# EasyEDA Pro project six-port-baseboard-v01.epro, board PCB1
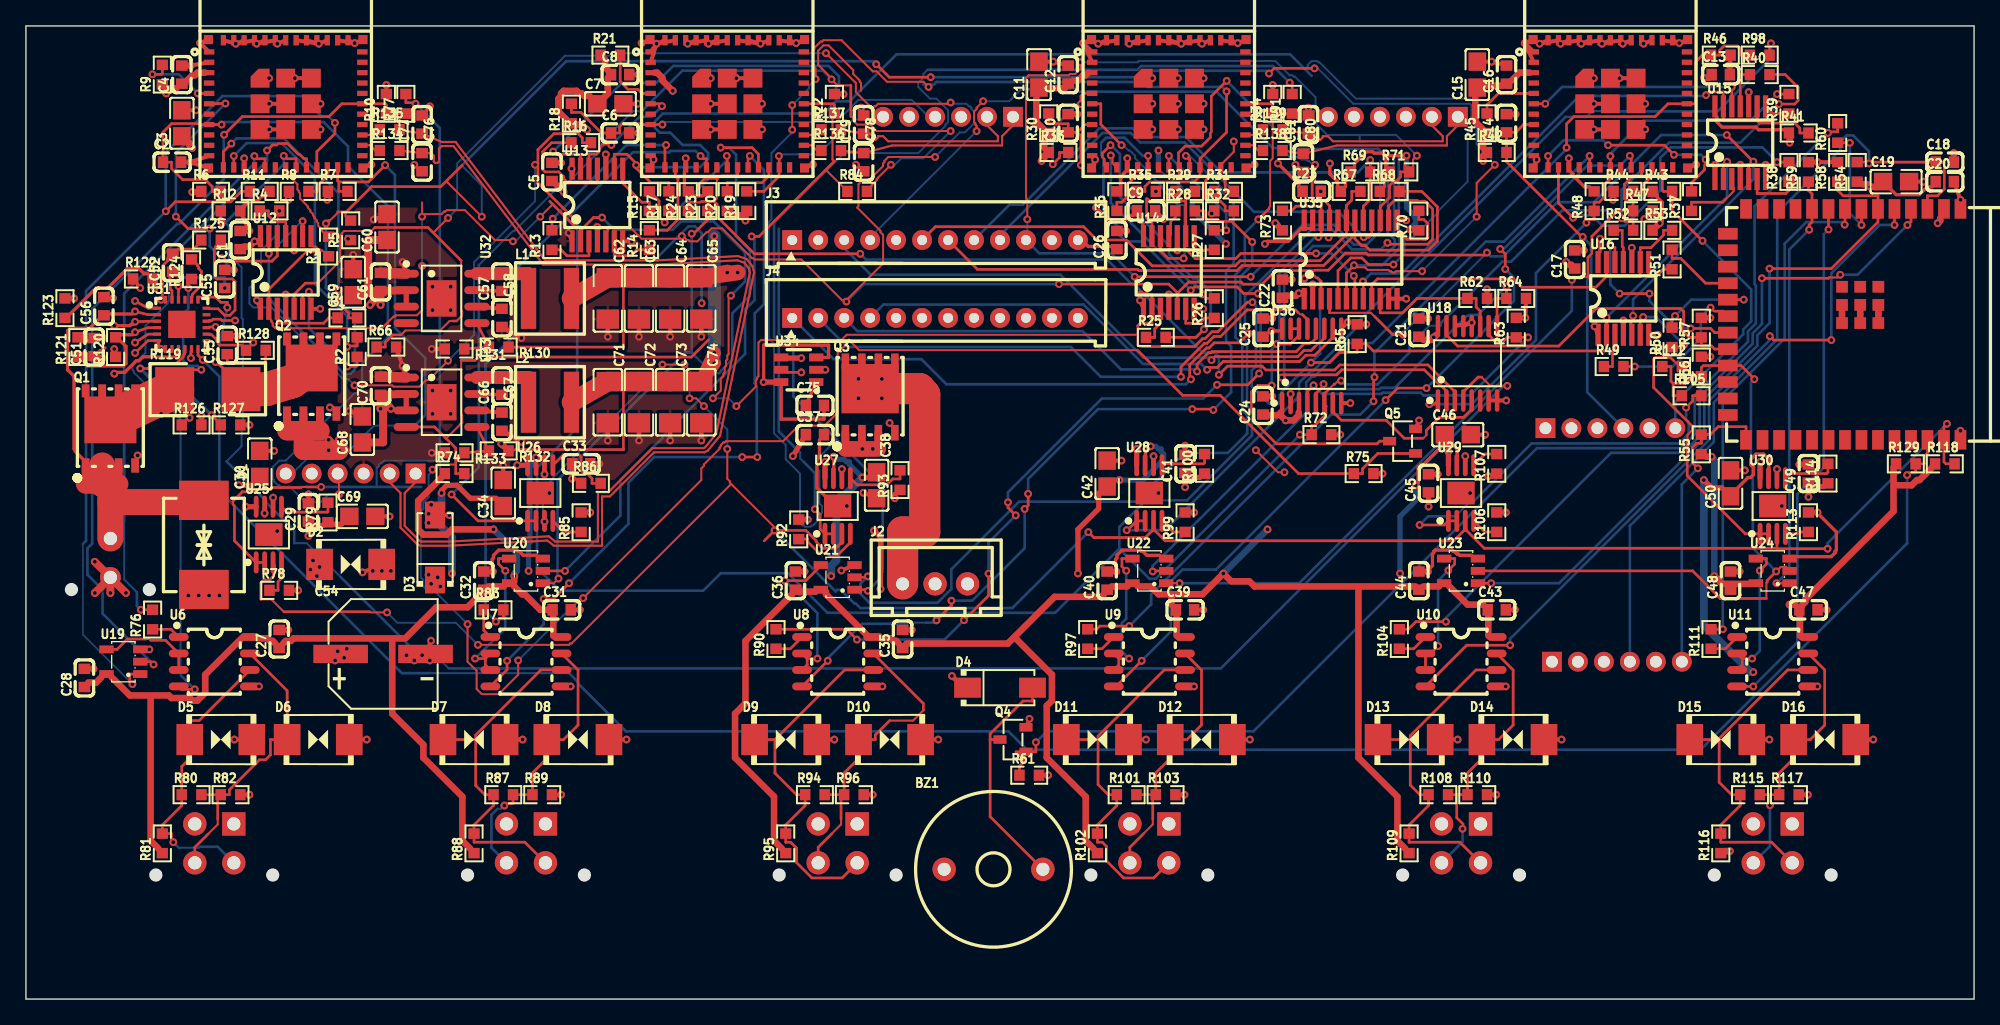
[diagram p12: board, top side]
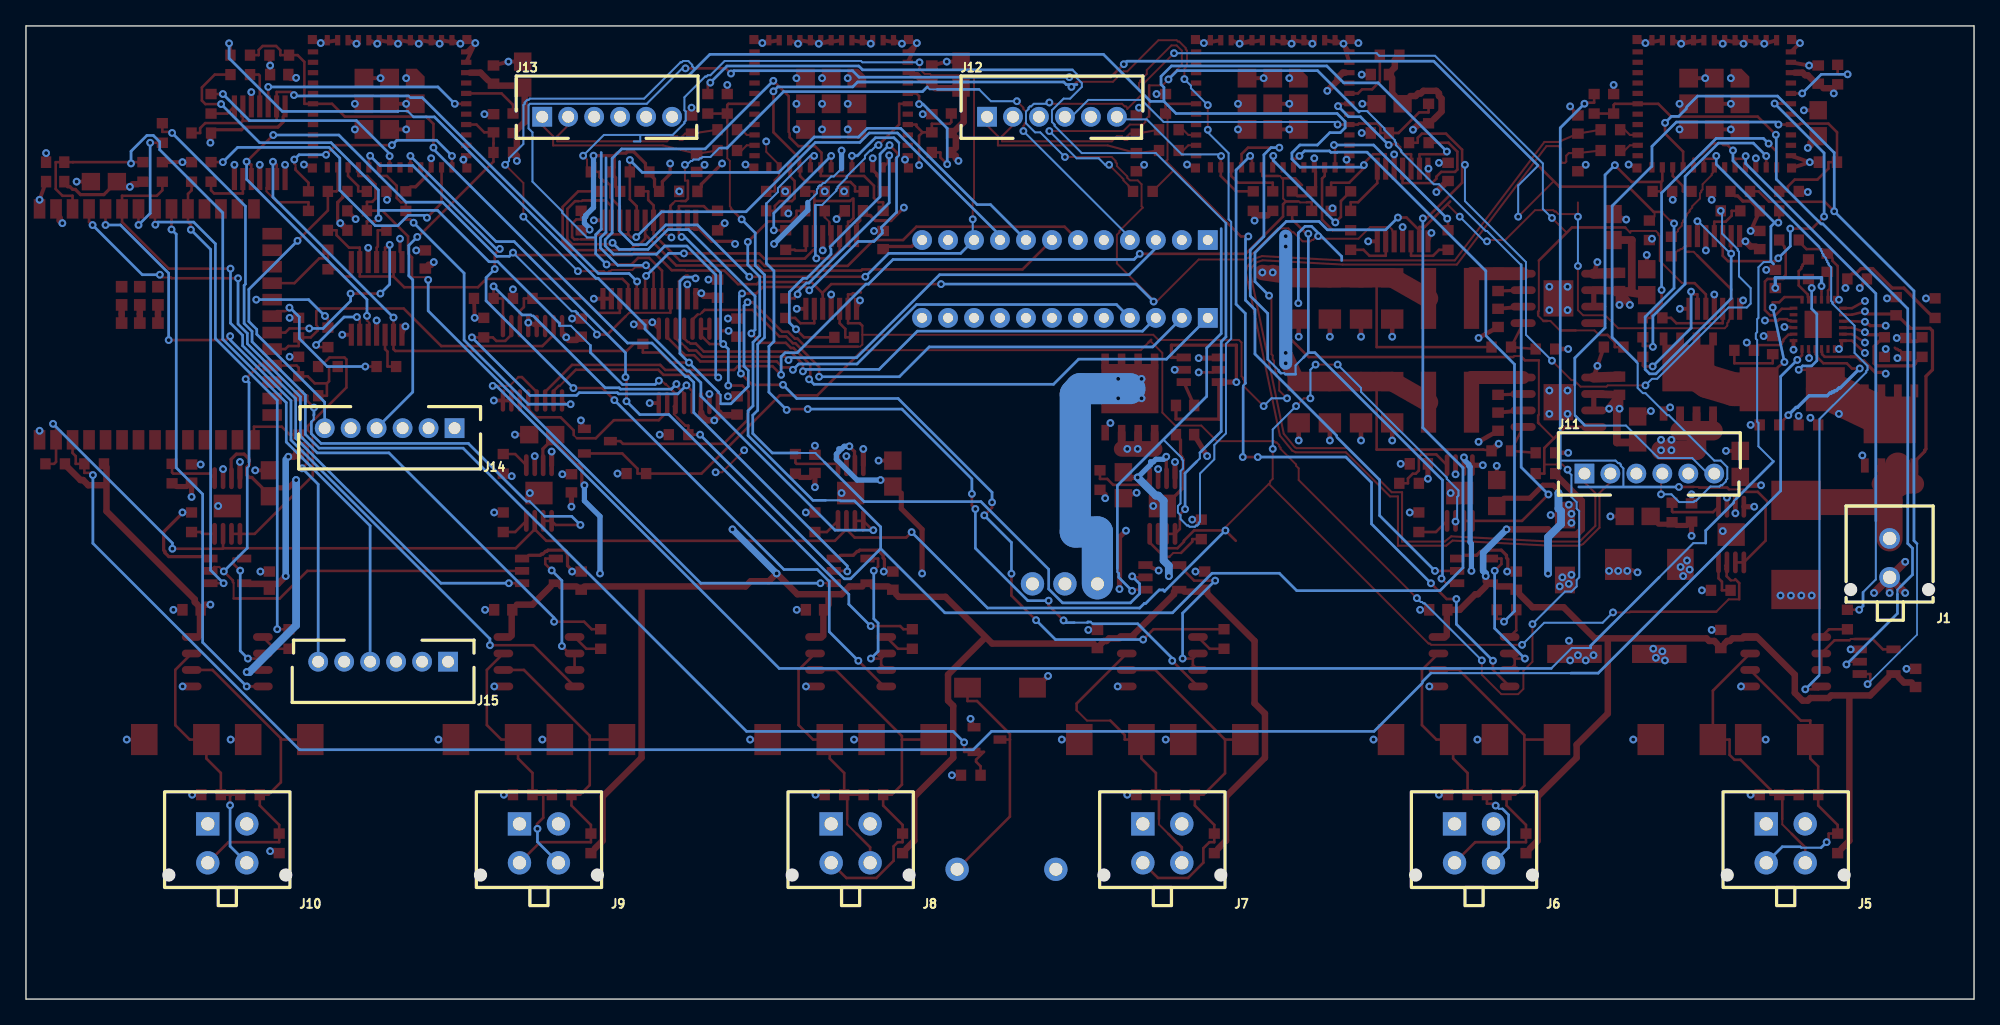
[diagram p13: board, bottom side, seen from below]

Outline 150 x 75 mm; copper layers: Top Layer, Inner1, Inner2, Bottom Layer. Coordinates in mm from the lower left corner of the outline.
Outline path: 0,75 150,75 150,0 0,0 0,75
Stack: Top Layer 0.035mm / Dielectric1 1.51mm FR4 er 4.5 / Bottom Layer 0.035mm

## Design rules (mm)
spacing copperThickness1oz (default): track to track 0.102, other pairs 0.152 to 0.3
spacing copperThickness2oz: track to track 0.203, other pairs 0.152 to 0.3
track width copperThickness1oz (default): min 0.127, default 0.254, max 2.54
track width copperThickness2oz: min 0.203, default 0.254, max 2.54
track width powerWide1oz: min 0.127, default 0.254, max 4
differential pair differentialPair (default): width min 0.127, default 0.254, max 2.54; gap min 0.152, default 0.152
net 5V_BUCK uses powerWide1oz
net 3V3 uses powerWide1oz
net 12V_PROTECTED uses powerWide1oz
net MAIN_N1 uses powerWide1oz
net 12V_RAW uses powerWide1oz
net 5V_SCREEN uses powerWide1oz
net MAIN_N2 uses powerWide1oz

## Placement (name value [footprint] x y rotation side)
BZ1  2.4kHz  [BUZ-TH_BD12.0-P7.60-D0.6-FD]  74.5 10 0 top
C1  100nF  [C0603]  16.5 58.5 90 top
C2  1uF  [C0603]  11.25 64.5 0 top
C3  10uF  [C0805]  12 67.5 90 top
C4  100nF  [C0603]  12 71.25 90 top
C5  100nF  [C0603]  40.5 63.75 90 top
C6  1uF  [C0603]  45.75 66.75 0 top
C7  10uF  [C0805]  45 69 0 top
C8  100nF  [C0603]  45.75 71.25 0 top
C9  100nF  [C0603]  86.25 60.75 0 top
C10  1uF  [C0603]  80.25 67.5 90 top
C11  10uF  [C0805]  78 71.25 90 top
C12  100nF  [C0603]  80.25 71.25 90 top
C13  100nF  [C0603]  130.5 71.25 0 top
C14  1uF  [C0603]  114 67.5 90 top
C15  10uF  [C0805]  111.75 71.25 90 top
C16  100nF  [C0603]  114 71.25 90 top
C17  100nF  [C0603]  119.25 57 90 top
C18  1uF  [C0603]  147.75 64.5 0 top
C19  10uF  [C0805]  144 63 0 top
C20  100nF  [C0603]  147.75 63 0 top
C21  100nF  [C0603]  107.25 51.75 90 top
C22  100nF  [C0603]  96.75 54.75 90 top
C23  100nF  [C0603]  99 62.25 0 top
C24  100nF  [C0603]  95.25 45.75 90 top
C25  100nF  [C0603]  95.25 51.75 90 top
C26  1uF  [C0603]  84 58.5 90 top
C27  100nF  [C0603]  19.5 27.75 90 top
C28  100nF  [C0603]  4.5 24.75 90 top
C29  1uF  [C0603]  21.75 37.5 90 top
C30  10uF  [C0805]  18 41.25 90 top
C31  100nF  [C0603]  41.25 30 0 top
C32  100nF  [C0603]  35.25 32.25 90 top
C33  1uF  [C0603]  42.75 41.25 0 top
C34  10uF  [C0805]  36.75 39 90 top
C35  100nF  [C0603]  67.5 27.75 90 top
C36  100nF  [C0603]  59.25 32.25 90 top
C37  1uF  [C0603]  60.75 43.5 0 top
C38  10uF  [C0805]  65.5 39.6 270 top
C39  100nF  [C0603]  89.25 30 0 top
C40  100nF  [C0603]  83.25 32.25 90 top
C41  1uF  [C0603]  89.25 41.25 90 top
C42  10uF  [C0805]  83.25 40.5 90 top
C43  100nF  [C0603]  113.25 30 0 top
C44  100nF  [C0603]  107.25 32.25 90 top
C45  1uF  [C0603]  108 39.75 90 top
C46  10uF  [C0805]  110.25 43.5 0 top
C47  100nF  [C0603]  137.25 30 0 top
C48  100nF  [C0603]  131.25 32.25 90 top
C49  1uF  [C0603]  137.25 40.5 90 top
C50  10uF  [C0805]  131.25 39.75 90 top
C51  68nF  [C0603]  5.25 50.25 90 top
C52  220nF  [C0603]  11.3 56.75 90 top
C53  2.2nF  [C0603]  15.5 50.4 90 top
C54  100uF  [CAP-SMD_BD8.0-L8.3-W8.3-FD]  27.5 26.6 0 top
C55  100nF  [C0603]  15.3 55.5 90 top
C56  100nF  [C0603]  6 53.4 90 top
C57  100nF  [C0603]  36.65 55.27 90 top
C58  1uF  [C0603]  36.65 52.5 270 top
C59  10uF  [C0805]  25.2 55.25 90 top
C60  10uF  [C0805]  27.8 59.5 90 top
C61  220nF  [C0603]  27.3 55.27 90 top
C62  22uF  [C1206]  44.8 54 270 top
C63  22uF  [C1206]  47.2 54 270 top
C64  22uF  [C1206]  49.6 54 270 top
C65  22uF  [C1206]  52 54 270 top
C66  100nF  [C0603]  36.65 47.27 90 top
C67  1uF  [C0603]  36.65 44.5 270 top
C68  10uF  [C0805]  25.9 43.9 90 top
C69  10uF  [C0805]  25.9 37.2 0 top
C70  220nF  [C0603]  27.3 47.27 90 top
C71  22uF  [C1206]  44.8 46 270 top
C72  22uF  [C1206]  47.2 46 270 top
C73  22uF  [C1206]  49.6 46 270 top
C74  22uF  [C1206]  52 46 270 top
C75  100nF  [C0603]  60.75 45.75 0 top
C76  10pF  [C0603]  30.5 64.5 270 top
C77  10pF  [C0603]  30.5 67.4 90 top
C78  10pF  [C0603]  64.5 64.5 270 top
C79  10pF  [C0603]  64.5 67.4 90 top
C80  10pF  [C0603]  98.36 64.45 270 top
C81  10pF  [C0603]  98.75 67.4 90 top
D1  SMCJ24CA  [SMC_L6.9-W5.9-LS7.9-BI]  13.7 35 270 top
D2  SMBJ18CA  [SMB_L4.6-W3.6-LS5.3-BI]  25 33.5 0 top
D3  SS54  [SMA_L4.4-W2.8-LS5.4-R-RD]  31.5 34.8 90 top
D4  SS54  [SMA_L4.4-W2.8-LS5.4-R-RD]  75 24 0 top
D5  SMBJ36CA  [SMB_L4.6-W3.6-LS5.3-BI]  15 20 0 top
D6  SMBJ36CA  [SMB_L4.6-W3.6-LS5.3-BI]  22.5 20 0 top
D7  SMBJ36CA  [SMB_L4.6-W3.6-LS5.3-BI]  34.5 20 0 top
D8  SMBJ36CA  [SMB_L4.6-W3.6-LS5.3-BI]  42.5 20 0 top
D9  SMBJ36CA  [SMB_L4.6-W3.6-LS5.3-BI]  58.5 20 0 top
D10  SMBJ36CA  [SMB_L4.6-W3.6-LS5.3-BI]  66.5 20 0 top
D11  SMBJ36CA  [SMB_L4.6-W3.6-LS5.3-BI]  82.5 20 0 top
D12  SMBJ36CA  [SMB_L4.6-W3.6-LS5.3-BI]  90.5 20 0 top
D13  SMBJ36CA  [SMB_L4.6-W3.6-LS5.3-BI]  106.5 20 0 top
D14  SMBJ36CA  [SMB_L4.6-W3.6-LS5.3-BI]  114.5 20 0 top
D15  SMBJ36CA  [SMB_L4.6-W3.6-LS5.3-BI]  130.5 20 0 top
D16  SMBJ36CA  [SMB_L4.6-W3.6-LS5.3-BI]  138.5 20 0 top
J1  430450227  [CONN-TH_43045-0227]  6.5 34 0 bottom
J2  XH-3A  [CONN-TH_XH-3A]  70 32 0 top
J3  PH-12A  [CONN-TH_PH-12A]  70 58.5 0 top
J4  PH-12A  [CONN-TH_PH-12A]  70 52.5 0 top
J5  430450427  [CONN-TH_430450427]  14.5 12 0 bottom
J6  430450427  [CONN-TH_430450427]  38.5 12 0 bottom
J7  430450427  [CONN-TH_430450427]  62.5 12 0 bottom
J8  430450427  [CONN-TH_430450427]  86.5 12 0 bottom
J9  430450427  [CONN-TH_430450427]  110.5 12 0 bottom
J10  430450427  [CONN-TH_430450427]  134.5 12 0 bottom
J11  PH-6A  [CONN-TH_6P-P2.00_B6B-PH-K-1]  25 40.5 180 bottom
J12  PH-6A  [CONN-TH_6P-P2.00_B6B-PH-K-1]  71 68 180 bottom
J13  PH-6A  [CONN-TH_6P-P2.00_B6B-PH-K-1]  105.25 68 180 bottom
J14  PH-6A  [CONN-TH_6P-P2.00_B6B-PH-K-1]  122 44 0 bottom
J15  PH-6A  [CONN-TH_6P-P2.00_B6B-PH-K-1]  122.5 26 0 bottom
L1  2.2uH  [IND-SMD_L5.5-W5.3_XGL5030]  40.35 54 0 top
L2  2.2uH  [IND-SMD_L5.5-W5.3_XGL5030]  40.35 46 0 top
Q1  BSC040N10NS5  [PG-TDSON-8_L5.9-W5.1-P1.27-LS6.1-BL]  6.5 44 0 top
Q2  BSC040N10NS5  [PG-TDSON-8_L5.9-W5.1-P1.27-LS6.1-BL]  22 48 0 top
Q3  CSD17578Q5A  [DFN-8_L5.8-W4.9-P1.27-LS6.0-BL-1]  65 46.4 0 top
Q4  AO3400A  [SOT-23-3_L2.9-W1.3-P1.90-LS2.4-BR]  76 20 0 top
Q5  AO3400A  [SOT-23-3_L2.9-W1.3-P1.90-LS2.4-BR]  106 43 0 top
R1  220Ω  [R0603]  24.75 52.5 0 top
R2  220Ω  [R0603]  25.5 50.25 90 top
R3  220Ω  [R0603]  23.3 58 90 top
R4  33Ω  [R0603]  18.75 60.75 0 top
R5  2.2kΩ  [R0603]  25 59.25 90 top
R6  10kΩ  [R0603]  14.25 62.25 0 top
R7  10kΩ  [R0603]  24 62.25 0 top
R8  10kΩ  [R0603]  21 62.25 0 top
R9  10kΩ  [R0603]  10.5 71.25 90 top
R10  2.2kΩ  [R0603]  27.75 69 90 top
R11  10kΩ  [R0603]  18 62.25 0 top
R12  10kΩ  [R0603]  15.75 60.75 0 top
R13  220Ω  [R0603]  40.5 58.5 90 top
R14  220Ω  [R0603]  48 58.5 90 top
R15  220Ω  [R0603]  48 61.5 90 top
R16  33Ω  [R0603]  42.75 66 0 top
R17  2.2kΩ  [R0603]  49.5 61.5 90 top
R18  10kΩ  [R0603]  42 68.25 90 top
R19  10kΩ  [R0603]  55.5 61.5 90 top
R20  10kΩ  [R0603]  54 61.5 90 top
R21  10kΩ  [R0603]  45 72.75 0 top
R22  2.2kΩ  [R0603]  62.25 69 90 top
R23  10kΩ  [R0603]  52.5 61.5 90 top
R24  10kΩ  [R0603]  51 61.5 90 top
R25  220Ω  [R0603]  87 51 0 top
R26  220Ω  [R0603]  91.5 53.25 90 top
R27  220Ω  [R0603]  91.5 58.5 90 top
R28  33Ω  [R0603]  89.25 60.75 0 top
R29  2.2kΩ  [R0603]  89.25 62.25 0 top
R30  10kΩ  [R0603]  78.75 67.5 90 top
R31  10kΩ  [R0603]  92.25 62.25 0 top
R32  10kΩ  [R0603]  92.25 60.75 0 top
R33  10kΩ  [R0603]  79.5 65.25 0 top
R34  2.2kΩ  [R0603]  96 69 90 top
R35  10kΩ  [R0603]  86.25 62.25 0 top
R36  10kΩ  [R0603]  84 61.5 90 top
R37  220Ω  [R0603]  128.25 61.5 90 top
R38  220Ω  [R0603]  135.75 63.75 90 top
R39  220Ω  [R0603]  135.75 69 90 top
R40  33Ω  [R0603]  133.5 71.25 0 top
R41  2.2kΩ  [R0603]  136.5 66.75 0 top
R42  10kΩ  [R0603]  113.25 65.25 0 top
R43  10kΩ  [R0603]  126 62.25 0 top
R44  10kΩ  [R0603]  123 62.25 0 top
R45  10kΩ  [R0603]  112.5 67.5 90 top
R46  2.2kΩ  [R0603]  130.5 72.75 0 top
R47  10kΩ  [R0603]  124.5 60.75 0 top
R48  10kΩ  [R0603]  120.75 61.5 90 top
R49  220Ω  [R0603]  122.25 48.75 0 top
R50  220Ω  [R0603]  126.75 51 90 top
R51  220Ω  [R0603]  126.75 57 90 top
R52  33Ω  [R0603]  123 59.25 0 top
R53  2.2kΩ  [R0603]  126 59.25 0 top
R54  10kΩ  [R0603]  141 63.75 90 top
R55  10kΩ  [R0603]  129 42.75 90 top
R56  2.2kΩ  [R0603]  129 48.75 90 top
R57  10kΩ  [R0603]  129 51.75 90 top
R58  10kΩ  [R0603]  139.5 63.75 90 top
R59  10kΩ  [R0603]  137.25 63.75 90 top
R60  100Ω  [R0603]  139.5 66.75 90 top
R61  10kΩ  [R0603]  77.25 17.25 0 top
R62  10kΩ  [R0603]  111.75 54 0 top
R63  10kΩ  [R0603]  114.75 51.75 90 top
R64  10kΩ  [R0603]  114.75 54 0 top
R65  10kΩ  [R0603]  102.5 51.25 90 top
R66  10kΩ  [R0603]  27.75 50.25 0 top
R67  2.2kΩ  [R0603]  102 62.25 0 top
R68  2.2kΩ  [R0603]  105 62.25 0 top
R69  2.2kΩ  [R0603]  102.75 63.75 0 top
R70  2.2kΩ  [R0603]  107.25 60 90 top
R71  2.2kΩ  [R0603]  105.75 63.75 0 top
R72  2.2kΩ  [R0603]  99.75 43.5 0 top
R73  2.2kΩ  [R0603]  96.75 60 90 top
R74  10kΩ  [R0603]  33 40.5 0 top
R75  100kΩ  [R0603]  103 40.5 0 top
R76  1kΩ  [R0603]  9.75 29.25 90 top
R77  4.7kΩ  [R0603]  29.25 69 90 top
R78  6.19kΩ  [R0603]  19.5 31.5 0 top
R79  100kΩ  [R0603]  23.25 37.5 90 top
R80  120Ω  [R0603]  12.75 15.75 0 top
R81  390Ω  [R0603]  10.5 12 90 top
R82  390Ω  [R0603]  15.75 15.75 0 top
R83  1kΩ  [R0603]  36 30 0 top
R84  4.7kΩ  [R0603]  64 62.25 0 top
R85  6.19kΩ  [R0603]  42.75 36.75 90 top
R86  100kΩ  [R0603]  43.5 39.75 0 top
R87  120Ω  [R0603]  36.75 15.75 0 top
R88  390Ω  [R0603]  34.5 12 90 top
R89  390Ω  [R0603]  39.75 15.75 0 top
R90  1kΩ  [R0603]  57.75 27.75 90 top
R91  4.7kΩ  [R0603]  97.5 69 90 top
R92  6.19kΩ  [R0603]  59.5 36.2 90 top
R93  100kΩ  [R0603]  67.3 40 90 top
R94  120Ω  [R0603]  60.75 15.75 0 top
R95  390Ω  [R0603]  58.5 12 90 top
R96  390Ω  [R0603]  63.75 15.75 0 top
R97  1kΩ  [R0603]  81.75 27.75 90 top
R98  4.7kΩ  [R0603]  133.5 72.75 0 top
R99  6.19kΩ  [R0603]  89.25 36.75 90 top
R100  100kΩ  [R0603]  90.75 41.25 90 top
R101  120Ω  [R0603]  84.75 15.75 0 top
R102  390Ω  [R0603]  82.5 12 90 top
R103  390Ω  [R0603]  87.75 15.75 0 top
R104  1kΩ  [R0603]  105.75 27.75 90 top
R105  4.7kΩ  [R0603]  128.25 46.5 0 top
R106  6.19kΩ  [R0603]  113.25 36.75 90 top
R107  100kΩ  [R0603]  113.25 41.25 90 top
R108  120Ω  [R0603]  108.75 15.75 0 top
R109  390Ω  [R0603]  106.5 12 90 top
R110  390Ω  [R0603]  111.75 15.75 0 top
R111  1kΩ  [R0603]  129.75 27.75 90 top
R112  4.7kΩ  [R0603]  126.75 48.75 0 top
R113  6.19kΩ  [R0603]  137.25 36.75 90 top
R114  100kΩ  [R0603]  138.75 40.5 90 top
R115  120Ω  [R0603]  132.75 15.75 0 top
R116  390Ω  [R0603]  130.5 12 90 top
R117  390Ω  [R0603]  135.75 15.75 0 top
R118  10kΩ  [R0603]  147.75 41.25 0 top
R119  2mΩ  [RES-SMD_L6.4-W3.2-A]  14 47 0 top
R120  107kΩ  [R0603]  6.9 50.25 90 top
R121  9.09kΩ  [R0603]  4 50.25 90 top
R122  95.3kΩ  [R0603]  9 55.5 0 top
R123  3.32kΩ  [R0603]  3 53.25 90 top
R124  75Ω  [R0603]  12.75 56.25 90 top
R125  1kΩ  [R0603]  14.25 58.5 0 top
R126  56.2kΩ  [R0603]  12.75 44.25 0 top
R127  3.32kΩ  [R0603]  15.75 44.25 0 top
R128  1kΩ  [R0603]  17.7 50 0 top
R129  10kΩ  [R0603]  144.75 41.25 0 top
R130  100kΩ  [R0603]  36.4 50.25 180 top
R131  24.9kΩ  [R0603]  33 50.1 180 top
R132  100kΩ  [R0603]  36.4 42.25 180 top
R133  43.2kΩ  [R0603]  33 42.1 180 top
R134  33Ω  [R0603]  28 65.4 0 top
R135  33Ω  [R0603]  28 67 0 top
R136  33Ω  [R0603]  62 65.4 0 top
R137  33Ω  [R0603]  62 67 0 top
R138  33Ω  [R0603]  96 65.4 0 top
R139  33Ω  [R0603]  96 67 0 top
U1  2.4GHz  [WIFIM-SMD_ESP32-C3-MINI-1]  20 69 0 top
U2  2.4GHz  [WIFIM-SMD_ESP32-C3-MINI-1]  54 69 0 top
U3  2.4GHz  [WIFIM-SMD_ESP32-C3-MINI-1]  88 69 0 top
U4  2.4GHz  [WIFIM-SMD_ESP32-C3-MINI-1]  122 69 0 top
U5  2.4GHz  [WIFIM-SMD_ESP32-S3-WROOM-1-N8]  140 52 270 top
U6  THVD2410DR  [SOIC-8_L4.9-W3.9-P1.27-LS6.0-TL]  14.5 26 0 top
U7  THVD2410DR  [SOIC-8_L4.9-W3.9-P1.27-LS6.0-TL]  38.5 26 0 top
U8  THVD2410DR  [SOIC-8_L4.9-W3.9-P1.27-LS6.0-TL]  62.5 26 0 top
U9  THVD2410DR  [SOIC-8_L4.9-W3.9-P1.27-LS6.0-TL]  86.5 26 0 top
U10  THVD2410DR  [SOIC-8_L4.9-W3.9-P1.27-LS6.0-TL]  110.5 26 0 top
U11  THVD2410DR  [SOIC-8_L4.9-W3.9-P1.27-LS6.0-TL]  134.5 26 0 top
U12  74LVC125APW,118  [TSSOP-14_L5.0-W4.4-P0.65-LS6.4-BL]  20 56 0 top
U13  74LVC125APW,118  [TSSOP-14_L5.0-W4.4-P0.65-LS6.4-BL]  44 61.2 0 top
U14  74LVC125APW,118  [TSSOP-14_L5.0-W4.4-P0.65-LS6.4-BL]  88 56 0 top
U15  74LVC125APW,118  [TSSOP-14_L5.0-W4.4-P0.65-LS6.4-BL]  132 66 0 top
U16  74LVC125APW,118  [TSSOP-14_L5.0-W4.4-P0.65-LS6.4-BL]  123 54 0 top
U18  SN74HCS151PWR  [TSSOP-16_L5.0-W4.4-P0.65-LS6.4-BL]  111 49 0 top
U19  SN74LVC1G08DBVR  [SOT-23-5_L3.0-W1.7-P0.95-LS2.8-BR]  7.5 26 0 top
U20  SN74LVC1G08DBVR  [SOT-23-5_L3.0-W1.7-P0.95-LS2.8-BR]  38.5 33 0 top
U21  SN74LVC1G08DBVR  [SOT-23-5_L3.0-W1.7-P0.95-LS2.8-BR]  62.5 32.5 0 top
U22  SN74LVC1G08DBVR  [SOT-23-5_L3.0-W1.7-P0.95-LS2.8-BR]  86.5 33 0 top
U23  SN74LVC1G08DBVR  [SOT-23-5_L3.0-W1.7-P0.95-LS2.8-BR]  110.5 33 0 top
U24  SN74LVC1G08DBVR  [SOT-23-5_L3.0-W1.7-P0.95-LS2.8-BR]  134.5 33 0 top
U25  TPS1H200AQDGNRQ1  [EMSOP-8_L3.0-W3.0-P0.65-LS4.9-BL-EP-A]  18.7 35.8 0 top
U26  TPS1H200AQDGNRQ1  [EMSOP-8_L3.0-W3.0-P0.65-LS4.9-BL-EP-A]  39.6 39 0 top
U27  TPS1H200AQDGNRQ1  [EMSOP-8_L3.0-W3.0-P0.65-LS4.9-BL-EP-A]  62.5 38 0 top
U28  TPS1H200AQDGNRQ1  [EMSOP-8_L3.0-W3.0-P0.65-LS4.9-BL-EP-A]  86.5 39 0 top
U29  TPS1H200AQDGNRQ1  [EMSOP-8_L3.0-W3.0-P0.65-LS4.9-BL-EP-A]  110.5 39 0 top
U30  TPS1H200AQDGNRQ1  [EMSOP-8_L3.0-W3.0-P0.65-LS4.9-BL-EP-A]  134.5 38 0 top
U31  LM74900QRGERQ1  [VQFN-24_L4.0-W4.0-P0.50-TL-EP2.1_RGE0024T]  12 52 0 top
U32  LMR33630BDDAR  [SOIC-8_L4.9-W3.9-P1.27-LS6.0-BL-EP2.8-1]  32 54 270 top
U33  LMR33630BDDAR  [SOIC-8_L4.9-W3.9-P1.27-LS6.0-BL-EP2.8-1]  32 46 270 top
U34  LM74700QDBVRQ1  [SOT-23-6_L2.9-W1.6-P0.95-LS2.8-BR]  59.5 48.5 0 top
U35  SN74AXC8T245PWR  [TSSOP-24_L7.8-W4.4-P0.65-LS6.4-BL]  102 57 0 top
U36  SN74AXC4T245PWR  [TSSOP-16_L5.0-W4.4-P0.65-LS6.4-BL]  99 48.8 0 top

## Footprints (pads in the part's own frame, mm; a bottom-side part is the same pattern mirrored in y, then rotated)
BUZ-TH_BD12.0-P7.60-D0.6-FD
  round 1.8 hole 1: 1(-3.8,0) 2(3.8,0)
C0603
  rect 0.8x0.9 smd: 1(-0.7,0) 2(0.7,0)
C0805
  rect 1.41x1.35 smd: 1(-1,0) 2(1,0)
C1206
  rect 1.485x1.728 smd: 1(-1.593,0) 2(1.593,0)
CAP-SMD_BD8.0-L8.3-W8.3-FD
  rect 4.2x1.4 smd: 1(-3.267,0) 2(3.267,0)
CONN-TH_6P-P2.00_B6B-PH-K-1
  rect 1.524x1.524 hole 0.914: 1(-5,0)
  round 1.524 hole 0.914: 2(-3,0) 3(-1,0) 4(1,0) 5(3,0) 6(5,0)
CONN-TH_43045-0227
  round 1.6 hole 1.02: 1(0,-1.5) 2(0,1.5)
CONN-TH_430450427
  rect 1.8x1.8 hole 1.02: 1(1.5,-1.5)
  round 1.8 hole 1.02: 2(-1.5,-1.5) 3(1.5,1.5) 4(-1.5,1.5)
CONN-TH_PH-12A
  rect 1.524x1.524 hole 0.762: 1(-11,0)
  round 1.524 hole 0.762: 2(-9,0) 3(-7,0) 4(-5,0) 5(-3,0) 6(-1,0) 7(1,0) 8(3,0) 9(5,0) 10(7,0) 11(9,0) 12(11,0)
CONN-TH_XH-3A
  round 1.8 hole 1: 1(-2.5,0) 2(0,0) 3(2.5,0)
DFN-8_L5.8-W4.9-P1.27-LS6.0-BL-1
  rect 0.58x1.2 smd: 1(-1.907,-2.75) 2(-0.637,-2.75) 3(0.632,-2.75) 4(1.903,-2.75) 5(1.907,2.75) 6(0.637,2.75) 7(-0.632,2.75) 8(-1.903,2.75)
  rect 4.4x3.8 smd: 9(0,0.646)
EMSOP-8_L3.0-W3.0-P0.65-LS4.9-BL-EP-A
  oval 0.364x1.692 smd: 1(-0.975,-2.146) 2(-0.325,-2.146) 3(0.325,-2.146) 4(0.975,-2.146) 5(0.975,2.146) 6(0.325,2.146) 7(-0.325,2.146) 8(-0.975,2.146)
  rect 2.1x1.75 smd: 9(0,0)
IND-SMD_L5.5-W5.3_XGL5030
  rect 1.18x4.7 smd: 1(-1.655,0) 2(1.655,0)
PG-TDSON-8_L5.9-W5.1-P1.27-LS6.1-BL
  rect 0.6x1.1 smd: 1(-1.905,-2.875) 2(-0.635,-2.875) 3(0.635,-2.875) 4(1.905,-2.875)
  rect 0.6x1 smd: 5(1.905,2.875) 6(0.635,2.875) 7(-0.635,2.875) 8(-1.905,2.875)
  rect 4x3.6 smd: 8(0,0.638)
R0603
  rect 0.806x0.864 smd: 1(-0.753,0) 2(0.753,0)
RES-SMD_L6.4-W3.2-A
  rect 3x3.4 smd: 1(-2.55,0) 2(2.55,0)
SMA_L4.4-W2.8-LS5.4-R-RD
  rect 2.062x1.539 smd: 1(2.503,0) 2(-2.503,0)
SMB_L4.6-W3.6-LS5.3-BI
  rect 2.047x2.4 smd: 1(-2.391,0) 2(2.391,0)
SMC_L6.9-W5.9-LS7.9-BI
  rect 3.03x3.82 smd: 1(-3.435,0) 2(3.435,0)
SOIC-8_L4.9-W3.9-P1.27-LS6.0-BL-EP2.8-1
  oval 0.602x1.941 smd: 1(-1.905,-2.72) 2(-0.635,-2.72) 3(0.635,-2.72) 4(1.905,-2.72) 5(1.905,2.72) 6(0.635,2.72) 7(-0.635,2.72) 8(-1.905,2.72)
  rect 2.8x2.3 smd: 9(0,0)
SOIC-8_L4.9-W3.9-P1.27-LS6.0-TL
  oval 1.52x0.6 smd: 1(-2.74,1.905) 2(-2.74,0.635) 3(-2.74,-0.635) 4(-2.74,-1.905) 5(2.74,-1.905) 6(2.74,-0.635) 7(2.74,0.635) 8(2.74,1.905)
SOT-23-3_L2.9-W1.3-P1.90-LS2.4-BR
  rect 1x0.65 smd: 1(1,-0.95) 2(1,0.95) 3(-1,0)
SOT-23-5_L3.0-W1.7-P0.95-LS2.8-BR
  rect 1.1x0.6 smd: 1(1.3,-0.95) 2(1.3,0) 3(1.3,0.95) 4(-1.3,0.95) 5(-1.3,-0.95)
SOT-23-6_L2.9-W1.6-P0.95-LS2.8-BR
  rect 1.1x0.6 smd: 1(1.35,-0.95) 2(1.35,0) 3(1.35,0.95) 4(-1.35,0.95) 5(-1.35,0) 6(-1.35,-0.95)
TSSOP-14_L5.0-W4.4-P0.65-LS6.4-BL
  rect 0.4x1.7 smd: 1(-1.95,-2.8) 2(-1.3,-2.8) 3(-0.65,-2.8) 4(0,-2.8) 5(0.65,-2.8) 6(1.3,-2.8) 7(1.95,-2.8) 8(1.95,2.8) 9(1.3,2.8) 10(0.65,2.8) 11(0,2.8) 12(-0.65,2.8) 13(-1.3,2.8) 14(-1.95,2.8)
TSSOP-16_L5.0-W4.4-P0.65-LS6.4-BL
  oval 0.343x1.732 smd: 1(-2.275,-2.866) 2(-1.625,-2.866) 3(-0.975,-2.866) 4(-0.325,-2.866) 5(0.325,-2.866) 6(0.975,-2.866) 7(1.625,-2.866) 8(2.275,-2.866) 9(2.275,2.866) 10(1.625,2.866) 11(0.975,2.866) 12(0.325,2.866) 13(-0.325,2.866) 14(-0.975,2.866) 15(-1.625,2.866) 16(-2.275,2.866)
TSSOP-24_L7.8-W4.4-P0.65-LS6.4-BL
  rect 0.4x1.65 smd: 1(-3.575,-3.022) 2(-2.925,-3.022) 3(-2.275,-3.022) 4(-1.625,-3.022) 5(-0.975,-3.022) 6(-0.325,-3.022) 7(0.325,-3.022) 8(0.975,-3.022) 9(1.625,-3.022) 10(2.275,-3.022) 11(2.925,-3.022) 12(3.575,-3.022) 13(3.575,3.022) 14(2.925,3.022) 15(2.275,3.022) 16(1.625,3.022) 17(0.975,3.022) 18(0.325,3.022) 19(-0.325,3.022) 20(-0.975,3.022) 21(-1.625,3.022) 22(-2.275,3.022) 23(-2.925,3.022) 24(-3.575,3.022)
VQFN-24_L4.0-W4.0-P0.50-TL-EP2.1_RGE0024T
  rect 0.6x0.25 smd: 1(-1.9,1.245) 2(-1.9,0.744) 3(-1.9,0.244) 4(-1.9,-0.257) 5(-1.9,-0.754) 6(-1.9,-1.255) 13(1.9,-1.255) 14(1.9,-0.754) 15(1.9,-0.257) 16(1.9,0.244) 17(1.9,0.744) 18(1.9,1.244)
  rect 0.25x0.6 smd: 7(-1.254,-1.9) 8(-0.756,-1.9) 9(-0.256,-1.9) 10(0.244,-1.9) 11(0.745,-1.9) 12(1.245,-1.9) 19(1.245,1.9) 20(0.745,1.9) 21(0.244,1.9) 22(-0.256,1.9) 23(-0.756,1.9) 24(-1.254,1.9)
  rect 2.1x2.1 smd: 25(0.001,0)
WIFIM-SMD_ESP32-C3-MINI-1
  rect 0.8x0.4 smd: 1(-5.9,4) 2(-5.9,3.2) 3(-5.9,2.4) 4(-5.9,1.6) 5(-5.9,0.8) 6(-5.9,0) 7(-5.9,-0.8) 8(-5.9,-1.6) 9(-5.9,-2.4) 10(-5.9,-3.2) 11(-5.9,-4) 25(5.9,-4) 26(5.9,-3.2) 27(5.9,-2.4) 28(5.9,-1.6) 29(5.9,-0.8) 30(5.9,0) 31(5.9,0.8) 32(5.9,1.6) 33(5.9,2.4) 34(5.9,3.2) 35(5.9,4)
  rect 0.4x0.8 smd: 12(-4.8,-4.9) 13(-4,-4.9) 14(-3.2,-4.9) 15(-2.4,-4.9) 16(-1.6,-4.9) 17(-0.8,-4.9) 18(0,-4.9) 19(0.8,-4.9) 20(1.6,-4.9) 21(2.4,-4.9) 22(3.2,-4.9) 23(4,-4.9) 24(4.8,-4.9) 36(4.8,4.9) 37(4,4.9) 38(3.2,4.9) 39(2.4,4.9) 40(1.6,4.9) 41(0.8,4.9) 42(0,4.9) 43(-0.8,4.9) 44(-1.6,4.9) 45(-2.4,4.9) 46(-3.2,4.9) 47(-4,4.9) 48(-4.8,4.9)
  custom 1.45x1.45 smd: 49(-1.975,1.975)
  rect 1.45x1.45 smd: 49(-1.975,0) 49(-1.975,-1.975) 49(0,1.975) 49(0,0) 49(0,-1.975) 49(1.975,1.975) 49(1.975,0) 49(1.975,-1.975)
  rect 0.7x0.7 smd: 50(5.95,4.95) 51(5.95,-4.95) 52(-5.95,-4.95) 53(-5.95,4.95)
WIFIM-SMD_ESP32-S3-WROOM-1-N8
  rect 1.5x0.9 smd: 1(-8.9,8.954) 2(-8.9,7.684) 3(-8.9,6.415) 4(-8.9,5.144) 5(-8.9,3.874) 6(-8.9,2.604) 7(-8.9,1.335) 8(-8.9,0.065) 9(-8.9,-1.206) 10(-8.9,-2.475) 11(-8.9,-3.745) 12(-8.9,-5.016) 13(-8.9,-6.285) 14(-8.9,-7.556) 27(8.9,-7.556) 28(8.9,-6.285) 29(8.9,-5.016) 30(8.9,-3.745) 31(8.9,-2.475) 32(8.9,-1.206) 33(8.9,0.065) 34(8.9,1.335) 35(8.9,2.604) 36(8.9,3.874) 37(8.9,5.144) 38(8.9,6.415) 39(8.9,7.684) 40(8.9,8.954)
  rect 0.9x1.5 smd: 15(-6.985,-8.954) 16(-5.715,-8.954) 17(-4.445,-8.954) 18(-3.175,-8.954) 19(-1.905,-8.954) 20(-0.635,-8.954) 21(0.635,-8.954) 22(1.905,-8.954) 23(3.175,-8.954) 24(4.445,-8.954) 25(5.715,-8.954) 26(6.985,-8.954)
  rect 0.9x0.9 smd: 41(-2.9,2.635) 41(-2.9,1.235) 41(-2.9,-0.165) 41(-1.5,2.635) 41(-1.5,1.235) 41(-1.5,-0.165) 41(-0.1,2.635) 41(-0.1,1.235) 41(-0.1,-0.165)

## Nets
As in the schematic.

Pads without a net: J3 1 2; J4 5 6 7 9 10 12; U1 4 7 9 10 15 17 24 25 28 29 31 32 33 34 35; U2 4 7 9 10 15 17 24 25 28 29 31 32 33 34 35; U3 4 7 9 10 15 17 24 25 28 29 31 32 33 34 35; U4 4 7 9 10 15 17 24 25 28 29 31 32 33 34 35; U5 11 12 15 16 17 24 25 26 28 29 30 31 32 33 34 35 36 37; U18 6; U31 8 17 21 25; U32 4

## Via types
v1: diameter 0.6, hole 0.3, Top Layer to Bottom Layer, 687 vias

## Routing (per net, layer and track width the routed paths; a pad name or vN(x,y) marks a point on that pad's centre or on a via; arc(x,y) is an arc through that point)
3V3: length 628.4
  Top Layer w0.2: R132.1 37.8,42.35 46,42.35 46,47.59
  Top Layer w0.25: 125.6,62 125.6,61.8 126,61.4 126,60 ; 135.4,67 133.4,67 133.2,67.2 130.6,67.2 130.2,67.6 130.2,68 ; 86,59.6 86,59.8 85.8,60 85.8,60.4 ; 146.8,62.6 146.6,62.6 146.4,62.4 146.2,62.4 145.8,62 144,62 143.6,62.4 ; v1(82.4,61) 83.4,60 84.6,60 85,60.4 85.2,60.4 ; 121.2,57.6 v1(121.2,58.6)
  Top Layer w0.5: 108.8,31.8 107.6,31.8 ; 13.2,62.2 v1(12.8,62.2) ; v1(78.2,64.6) 78.4,64.8 78.4,65 ; 136.2,30.4 v1(135.8,30.4) ; 19.8,27.4 20,27.6 20.4,27.6 20.6,27.8 29.2,27.8 31.6,30.2 34,30.2 35,31.2 ; 55.4,60.4 v1(55.4,60) ; 80.6,70.8 81,70.8 81.4,71.2 81.6,71.2 81.8,71.4 ; 6.6,24.8 8,23.4 11,23.4 11.2,23.2 12.6,23.2 12.8,23 13.2,23 13.8,23.6 13.8,25 16.6,27.8 ; 67.8,27.4 75.6,27.4 79.2,31 82.8,31 83,31.2 ; 129.6,71 v1(129.2,71) ; 44.6,72.4 44.6,71.8 44.8,71.6 ; 44.8,71 44.8,69.8 44.6,69.6 ; 12.6,66 12.6,65.8 v1(12.8,65.6) ; 5.8,24.8 5.4,24.4 4.8,24.4 ; 17.4,58.2 17.2,58 16.8,58 ; 109.6,31.8 111,30.4 112.2,30.4 ; 9.6,23.2 9.6,12.2 10.2,11.6 ; 11.6,70.2 11,70.2 ; 135.8,66.4 v1(135.8,66) ; 102.6,31.6 102.6,18.6 105.6,15.6 105.6,12.2 106.2,11.6 ; 78.4,66.4 78.4,65.6 ; 82.2,11.6 81.6,12.2 81.6,15.6 78.6,18.6 78.6,22.6 79,23 79,25 76.2,27.8 ; 41.6,67.8 41,68.4 41,69.4 41.2,69.6 41.2,69.8 41.4,70 42.4,70 42.6,69.8 42.8,69.8 43,69.6 43.4,69.6 ; 144,39.6 145.2,39.6 145.6,40 145.8,40 146.8,41 ; 61.6,31.4 61.6,31.2 64.8,28 ; 143.8,41 143.8,37.6 137,30.8 137,30.6 136.8,30.4 ; 88.2,30.4 88.2,31 ; 40.8,62.8 v1(41.4,62.2) ; 95.6,45 96.4,45 ; 54.4,60.4 55.2,60.4 ; 136.6,28 136.6,29.6 ; 111.6,69.6 111.6,67.6 112.2,67 ; 40.6,28 40.6,29.6 ; 113.6,70.4 112.4,70.4 ; 77.8,69.6 77.8,67.6 78.4,67 ; 142.4,62.6 v1(142,62.6) ; 10.8,70.2 v1(10.8,69.8) ; 13.8,71.4 13.2,71.4 13,71.2 12.8,71.2 12.4,70.8 ; v1(43.2,67) 42.8,67.4 42.4,67.4 ; v1(97,44.6) 97.6,44.6 98,45 98,45.2 ; 112.2,66.4 112.2,65.6 ; 129.4,41.8 v1(129.8,41.8) ; 58.2,11.6 57.6,12.2 57.6,15.6 54.6,18.6 54.6,22 55.4,22.8 55.4,27.6 59,31.2 ; 59.6,31.4 60.8,31.4 ; 98.4,54.4 v1(98,54.4) ; 115.8,71.4 115,71.4 114.4,70.8 ; 122.2,62 v1(122.2,61.6) ; 92.4,32.6 92.8,32.2 94.2,32.2 94.6,31.8 107,31.8 ; 37.6,31.8 38.2,31.2 38.4,31.2 39.6,30 40.2,30 ; 132.8,32 130.6,32 v1(130,32.6) ; 65.8,27.8 66.6,27.8 66.8,27.6 67,27.6 67.2,27.4 ; v1(92.2,32.8) 90.6,31.2 87.2,31.2 86.6,31.8 85.6,31.8 ; 23.2,62 v1(23.2,61.6) ; 20.2,62 v1(20.2,61.6) ; 37.6,32.2 v1(37.6,32.6) ; 107.6,50.8 108.2,50.8 ; 34.2,11.6 33.6,12.2 33.6,15.6 30.6,18.6 30.6,19.6 28.2,22 28.2,27.6 ; 18,58.4 v1(17.6,58.4) ; 112.6,28 112.6,29.6 ; 147.4,60.2 147.4,60 v1(147.2,59.8) ; 97,54.2 97.8,54.2 ; v1(36,36.2) 32.8,36.2 32.4,35.8 30.6,35.8 30.2,36.2 30.2,38.4 32,40.2 ; 35.6,31.8 36.8,31.8 ; 112.2,65 v1(112.2,64.6) ; 130.8,11.4 v1(131.2,11.4) ; 96.6,45.2 96.6,45 96.8,44.8 ; 80,70.2 78.6,70.2 ; v1(118.6,56.8) 118.8,56.6 119,56.6 ; 83.6,31.8 84.8,31.8 ; 17.8,27.8 18.6,27.8 18.8,27.6 19,27.6 19.2,27.4 ; 96.4,59.6 v1(96.2,59.8) ; 48.4,71.4 48.6,71.4 49,71 49,70.8 v1(49.8,70) ; 88.6,28 88.6,29.6 ; 125.6,59.6 v1(125.8,59.8) ; 108.6,51.2 v1(108.4,51) ; v1(36.6,42.8) 36.8,42.6 ; 141.4,62.8 141.8,62.8
  Top Layer w1: v1(53,49) C74.1 v1(53,49.8)
  Top Layer w1.5: L2.2 C71.1 C72.1 C73.1 C74.1
  Inner2 w0.8: v1(95.6,36.2) 95.6,43.2 96.8,44.4 ; v1(78.2,64.6) 78.2,64.4 78,64.2 78,63.6 ; 13.6,63.6 13.6,64.8 v1(12.8,65.6) ; v1(108.4,51) 108.4,51.6 108.8,52 108.8,52.2 109,52.4 109,61 ; v1(43.2,67) 43.2,63.6 ; 97.5,61.3 101.9,61.3 ; v1(98,54.4) 97.2,54.4 96.6,55 96.6,55.2 96.4,55.4 96.4,59.6 ; v1(96.2,59.8) 96.2,61 ; v1(129.8,41.8) 129.8,42.8 128.8,43.8 128.8,48 126.8,50 126.8,50.2 126.6,50.4 126.6,51.6 126.2,52 126.2,52.2 126,52.4 126,59.6 ; v1(36,36.2) 36,40.6 35.8,40.8 35.8,42 v1(36.6,42.8) ; v1(118.6,56.8) 118.6,58.8 118.2,59.2 118.2,61 ; v1(135.8,30.4) 135.2,30.4 133.8,31.8 130.8,31.8 130.2,32.4 ; v1(49.8,70) 46.2,70 43.4,67.2 ; 98,54.2 98,48.8 98.2,48.6 98.2,47 98.4,46.8 98.4,46.4 97.8,45.8 97.8,45.4 v1(97,44.6) ; v1(55.4,60) 55.4,61 ; v1(131.2,11.4) 131.2,13.6 131.4,13.8 131.4,21.8 131.6,22 131.6,31.6 ; 142.4,61.8 142.8,61.4 145.6,61.4 v1(147.2,59.8) ; v1(135.8,66) 135.8,63.6 ; v1(24.8,58.6) 24.8,61 ; 97.5,63.3 101.9,63.3 ; v1(129.2,71) 129.4,71 131.2,69.2 132,69.2 132.2,69 132.8,69 135.6,66.2 ; v1(112.2,64.6) 112.2,63.6 ; 84.8,61.3 89.2,61.3 ; v1(10.8,69.8) 10.8,69.4 12.4,67.8 12.4,66 12.6,65.8 ; 18.2,61 18.2,59 18,58.8 18,58.6 17.8,58.4 v1(17.6,58.4) ; v1(121.2,58.6) 121.2,61 ; v1(125.8,59.8) 125.8,61 ; 84.8,63.3 89.2,63.3
  Inner2 w1: v1(53,49) v1(53,58.8)
  Inner2 w2: 17.3,62.3 23.5,62.3
  Inner2 w2.5: v1(53,58.8) 53,62.3
  Inner2 w3: 23.5,62.3 84.8,62.3 ; 101.9,62.3 141,62.3 ; 12,62.3 17.3,62.3 ; 89.2,62.3 97.5,62.3
  Bottom Layer w0.5: v1(130,32.6) 130,41.6 ; v1(92.2,32.8) v1(95.6,36.2) ; 36.2,36 37.8,34.4 37.8,33 37.6,32.8 v1(37.6,32.6)
  Bottom Layer w1: v1(53,49) v1(53,58.8)
  vias: v1(42.01,64) v1(49.4,60.95) v1(53,58) v1(88.5,62.25) v1(91.3,60.55) v1(91.54,62.25)
5V_BUCK: length 110.7
  Top Layer w0.2: R130.1 46,50.25 46,55.59
  Top Layer w0.25: v1(56.8,47.55) 56.8,50.4 61.8,50.4 61.8,49.45 U34.3 ; U34.6 58.15,44.7 61.45,44.7 C75.2
  Top Layer w0.4: U34.6 v1(56.8,47.55) ; 71.5,24.7 v1(71.3,24.9) ; v1(65.3,36.1) 65.8,35.6 v1(65.8,31.6)
  Top Layer w0.6: Q3.3 65.63,42.4 ; Q3.1 63.09,42.4 ; 64.36,42.4 Q3.2
  Top Layer w1.2: 63.09,42.4 65.63,42.4 ; v1(54.8,56) C65.1 v1(54,56)
  Top Layer w1.5: L1.2 C62.1 C63.1 C64.1 C65.1
  Inner2 w0.6: v1(54,56) 55.2,56
  Inner2 w0.8: v1(65.3,36.1) 65.3,37.4 65.4,37.5 65.4,40.5 64.7,41.2 ; 71,10.8 71,14.6 71.1,14.7 71.1,18.7 71.2,18.8 71.2,24.6 ; v1(71.3,24.9) 71.3,26.6 67.4,30.5 67.1,30.5 67,30.6 66.9,30.6 66.8,30.7 66.7,30.7 v1(65.8,31.6)
  Inner2 w2.5: v1(64.4,42.4) 64.4,43.6 56.5,43.6 56.5,54 55.2,56
  vias: v1(65.2,42.4)
5V_SCREEN: length 47.3
  Top Layer w0.4: 58.6,49.4 v1(59.7,49.4)
  Top Layer w2.4: J2.1 67.5,36 69.2,36 69.2,46.6 68.8,47.05 Q3.9
  Inner2 w0.8: 63.9,48 62.5,49.4 v1(59.7,49.4)
  Bottom Layer w2.4: Q3.9 68.8,47.05 69.2,46.6 69.2,36 67.5,36 J2.1
  vias: v1(64.1,47.8) v1(64.1,46.3) v1(65.9,47.8) v1(65.9,46.3)
12V_PROTECTED: length 303.6
  Top Layer w0.2: 14.1,51.8 v1(14.6,51.8)
  Top Layer w0.4: C45.1 v1(108,37.95) ; U28.8 v1(85.53,42.4) ; U32.3 U32.2 ; U30.8 v1(133.53,41.4) ; 22.9,36.5 22.1,36.5 ; 17.72,37.95 v1(16.92,37.95) ; C41.1 v1(89.25,39.45) ; 24.3,36.6 23.6,36.6 ; U29.8 v1(109.53,42.2) ; 66.9,38.9 v1(66.9,38.6) ; C37.1 v1(59.05,41.85) ; 112.9,40.3 v1(112.6,40.3) ; C29.1 v1(21.75,35.7) ; C33.1 v1(42.05,40.1) ; 138.4,39.5 137.6,39.5 ; U33.3 U33.2 ; C49.1 v1(137.25,38.7) ; U26.8 v1(37.83,41.15) ; U27.8 v1(61.53,41.4) ; 90.4,40.2 89.6,40.2
  Top Layer w0.6: 21.36,43.8 Q2.2 ; C61.1 v1(26.5,53.5) ; C61.1 C59.1 ; C61.1 v1(27.3,53.5) ; C61.1 26.35,54.57 26.35,58.5 C60.1 ; C61.1 U32.2 ; C70.1 27.5,46.57 27.5,46.3 ; C70.1 v1(27.3,45.5) ; C70.1 U33.2 ; C70.1 27.5,46.3 ; v1(23.3,43.1) v1(24.1,42.3) v1(24.1,43.1) ; 27.5,46.3 27.5,42.9 C68.1 ; 27.5,46.3 v1(28.1,45.5) ; Q2.1 20.09,43.8 ; Q2.3 22.64,43.8
  Top Layer w1.5: 20.09,43.8 21.36,43.8 ; 21.36,43.8 22.64,43.8 ; 21.36,43.8 21.36,42.3 v1(24.1,42.3)
  Inner2 w0.4: v1(21.75,35.7) 21.75,34.5 ; v1(61.53,41.4) 61.53,41.85 v1(59.05,41.85) ; v1(42.05,40.1) 42.05,34.5 ; v1(108,37.95) 108,34.5 ; v1(137.25,38.7) 137.25,34.5 ; v1(89.25,39.45) 89.25,34.5
  Inner2 w0.5: v1(14.6,51.8) 14.6,51.6 15.7,50.5 15.8,50.5 15.9,50.4 16,50.4 22.4,44
  Inner2 w0.6: 16.92,34.5 v1(16.92,37.95) ; 133.53,34.5 v1(133.53,41.4) ; 37.83,34.5 v1(37.83,41.15) ; v1(24.1,42.3) 24.1,43.6 ; 85.53,34.5 v1(85.53,42.4) ; v1(23.3,42.3) 23.3,43.6 ; 109.53,34.5 v1(109.53,42.2) ; 61.53,34.5 v1(61.53,41.4)
  Inner2 w0.8: v1(112.6,40.3) 109.8,40.3 ; v1(66.9,38.6) 66.9,35.4
  Inner2 w1.2: v1(27.3,53.5) v1(26.5,53.5) ; 26.8,45.5 v1(28.1,45.5)
  Inner2 w1.5: 26.8,43.6 34,43.6 34,34.5 ; 31.45,32.25 31.45,34.5 ; 22.25,33.2 22.25,34.5
  Inner2 w2: 24.25,34.5 137.25,34.5 ; 24.25,34.5 14.5,34.5 ; 24.25,34.5 24.25,26.55 ; 23.3,43.6 26.8,43.6 26.8,53.5
  vias: v1(21.9,33.1) v1(22.1,33.8) v1(22.4,32.6) v1(22.6,33.3) v1(23.8,26.1) v1(24,26.8) v1(24.5,26.3) v1(24.7,27) v1(31,32.7) v1(31.2,32) v1(31.7,32.5) v1(31.9,31.8)
12V_RAW: length 35.1
  Top Layer w0.2: U31.2 9.4,52.74 v1(8.4,53)
  Top Layer w0.25: 4.4,41.6 3.8,42.2 3.8,42.3 3.7,42.4 3.7,48 3.2,48.5 3.2,51.5 3.4,51.7 4.9,51.7 5.6,52.4 ; 8.2,52.8 6.4,52.8
  Top Layer w0.6: Q1.3 7.14,39.7 ; Q1.1 4.59,39.7
  Top Layer w1.5: 4.59,39.7 5.86,39.7 ; 6.5,39.7 7.14,39.7
  Top Layer w2: 6.5,38.3 13.7,38.3 D1.1 ; Q1.2 5.86,39.7 6.5,39.7 J1.1
GND: length 328.3
  Top Layer w0.25: 83.9,33.2 83.9,33.9 84,34 84,34.2 84.4,34.6 85.8,34.6 85.9,34.5 86,34.5 86.3,34.2 87.3,34.2 ; 118.9,63.8 119.1,63.6 119.1,63.5 120,62.6 120.4,62.6 ; C79.2 v1(64.3,68.7) ; 39.3,34.2 38.3,34.2 38,34.5 37.9,34.5 37.8,34.6 36.4,34.6 36,34.2 36,34 35.9,33.9 35.9,33.2 ; 108.1,33.2 108.3,33.4 108.3,34.3 108.4,34.4 108.4,34.5 108.5,34.6 109.8,34.6 109.9,34.5 110,34.5 110.2,34.3 110.3,34.3 110.4,34.2 111.3,34.2 ; C78.2 v1(63.9,64.3) ; C81.2 v1(98.75,68.7) ; 61.1,43.1 61.1,41.9 61,41.8 61,41.7 60.9,41.6 60.9,39.4 61.5,38.8 ; 84.7,63.8 84.5,63.6 84.5,63.5 84.3,63.3 84.3,62.6 ; 18.4,61.9 18.2,61.9 17.8,61.5 17.2,61.5 16.8,61.1 ; 50.7,62.6 50.7,63.8 ; C80.2 v1(97.75,64.3) ; C77.2 v1(31.1,68.8) ; 52.1,61.9 51.4,61.9 ; 138.1,37.3 139.4,36 139.4,34.6 139.3,34.5 139.3,34.4 139,34.1 136.3,34.1 ; C76.2 v1(29.9,64.3)
  Top Layer w0.3: U4.49 U4.49 ; D13.2 v1(110.24,20) ; C44.2 v1(107.95,32.95) ; U12.1 v1(17.78,53.85) ; U4.40 v1(122.95,73.63) ; U12.7 v1(22.65,53.2) ; U2.53 v1(47.4,73.68) ; U29.6 v1(110.82,41.85) ; U1.45 v1(16.15,73.63) ; v1(16.15,73.63) U1.46 ; v1(16.15,73.63) U1.48 ; C60.2 v1(26.78,60.08) ; C8.2 v1(47.15,71.25) ; C50.2 v1(132.35,40.75) ; U3.49 v1(88.7,67.03) ; R46.2 v1(131.2,71.95) C13.2 ; R113.2 v1(137.95,37.5) ; D16.2 v1(142.24,20) ; U16.10 v1(123.65,57.9) ; U4.44 v1(119.75,73.63) U4.43 ; U1.36 v1(25.3,73.68) ; v1(25.3,73.68) U1.50 ; v1(25.3,73.68) U1.37 ; U14.4 v1(88,54.3) ; U2.51 v1(60.6,64.32) ; U4.52 v1(116.32,64.7) ; U1.38 v1(22.55,73.63) ; v1(22.55,73.63) U1.41 ; v1(22.55,73.63) U1.40 ; R127.2 v1(17.2,44.25) ; C49.2 v1(136.55,41.2) ; R82.2 v1(17.2,15.75) ; R61.2 v1(78.7,17.25) ; R12.2 v1(17.2,59.2) C1.2 ; U4.14 v1(118.8,64.8) ; U3.49 v1(90.68,70.97) ; D14.2 v1(118.24,20) ; U3.2 v1(81.4,73.68) ; v1(81.4,73.68) U3.53 ; v1(81.4,73.68) U3.1 ; U3.51 v1(94.6,64.32) ; U15.10 v1(132.65,69.9) ; U4.45 v1(118.15,73.63) U4.46 ; U14.7 v1(90.65,53.2) ; C9.2 v1(87.59,60.11) ; D6.2 v1(26.24,20) ; U31.13 v1(13.9,50.05) ; U15.4 v1(132,64.3) ; U2.49 U2.49 ; D11.2 v1(86.24,20) ; U4.38 v1(124.55,73.63) ; U16.7 v1(125.65,51.2) ; U5.40 v1(148.95,43.8) ; U4.49 U4.49 ; R58.2 R59.2 ; U3.49 v1(86.72,70.97) ; R106.2 v1(113.95,37.5) ; D7.2 v1(38.24,20) ; U6.5 v1(17.94,24.09) ; U35.13 v1(106.28,60.02) ; U3.37 v1(93.3,73.68) ; v1(93.3,73.68) U3.50 ; v1(93.3,73.68) U3.36 ; D9.2 v1(62.24,20) ; U2.49 v1(56.67,67.03) ; U2.14 v1(50.8,64.8) ; C46.2 v1(112.35,43.5) ; C25.2 v1(95.95,52.45) ; U4.49 v1(120.72,70.97) ; C31.2 v1(42.65,30) ; U2.50 v1(59.3,73.68) ; v1(59.3,73.68) U2.37 ; v1(59.3,73.68) U2.36 ; U25.6 v1(19.03,38.65) ; R126.2 v1(13.5,44.95) ; R34.2 v1(96,70.45) ; U1.49 v1(22.67,67.03) ; v1(113.97,46.13) U18.8 U18.7 ; U9.5 v1(89.94,24.09) ; U15.1 v1(130.05,64.3) ; U2.45 v1(50.95,73.63) U2.44 ; C5.2 v1(41.2,64.45) ; U4.51 v1(128.6,64.32) ; U1.1 v1(13.4,73.68) U1.53 ; U2.52 v1(48.32,64.7) ; U36.9 v1(101.77,52.16) ; U1.14 v1(16.8,64.8) ; R65.2 v1(103.2,52) ; C15.2 v1(112.85,72.25) C16.2 ; U30.9 v1(135.2,38) ; D3.1 v1(32.6,37.3) ; U3.14 v1(84.8,64.8) ; U8.5 v1(65.94,24.09) ; C14.2 v1(114.7,68.2) ; U4.53 v1(115.4,73.68) ; v1(115.4,73.68) U4.2 ; v1(115.4,73.68) U4.1 ; U16.4 v1(123,52.3) ; R96.2 v1(65.2,15.75) ; R75.2 v1(104.45,40.5) ; U4.49 v1(124.68,67.03) ; C17.2 v1(119.95,57.7) ; U3.48 v1(82.55,73.63) U3.47 ; U1.11 v1(12.65,64.5) ; v1(12.65,64.5) C2.2 ; v1(12.65,64.5) U1.52 ; R10.2 v1(27.75,70.45) ; 3.4,54 v1(3.7,54) ; U2.48 v1(48.55,73.63) ; v1(48.55,73.63) U2.47 ; v1(48.55,73.63) U2.2 ; v1(48.55,73.63) U2.1 ; U27.6 v1(62.82,40.85) ; C18.2 v1(148.45,65.2) ; U1.49 U1.49 ; C19.2 v1(146.1,63) ; C40.2 v1(83.95,32.95) ; U13.7 v1(46.65,58.4) ; U7.5 v1(41.94,24.09) ; C54.2 v1(31.19,27.62) ; R72.2 v1(101.2,43.5) ; C20.2 v1(148.95,61.6) U5.1 ; U1.42 v1(19.35,73.63) ; R99.2 v1(89.95,37.5) ; U4.48 v1(116.55,73.63) U4.47 ; U2.49 v1(52.72,70.97) ; U2.49 U2.49 ; U26.6 v1(39.92,40.45) ; D12.2 v1(94.24,20) ; U2.42 v1(52.55,73.63) U2.43 ; C21.2 v1(107.95,52.45) ; U12.4 v1(20,54.3) ; U3.49 v1(86.72,69) ; U12.10 v1(20.65,57.7) ; U2.40 v1(56.55,73.63) ; v1(56.55,73.63) U2.41 ; v1(56.55,73.63) U2.38 ; U21.3 v1(62.78,33.03) ; R47.2 v1(124.62,60.11) ; C33.2 v1(44.15,41.25) ; R57.2 v1(129.7,52.5) ; R110.2 v1(113.2,15.75) ; U3.49 v1(86.72,67.03) ; U3.49 v1(90.68,69) ; C48.2 v1(131.95,32.95) ; C45.2 v1(108.7,40.45) ; C51.2 v1(5.95,50.95) ; U1.49 U1.49 ; C22.2 v1(97.45,55.45) ; U29.9 v1(111.2,39) ; U14.10 v1(88.65,57.7) ; C55.2 v1(16,56.2) ; U28.6 v1(86.82,41.85) ; R92.2 v1(60.2,36.95) ; R22.2 v1(62.95,69.75) ; U28.9 v1(87.2,39) ; U4.42 v1(121.35,73.63) U4.41 ; U35.11 U35.12 v1(106.28,53.98) ; U4.36 v1(127.3,73.68) ; v1(127.3,73.68) U4.50 ; v1(127.3,73.68) U4.37 ; C4.2 v1(12.7,71.95) U1.2 ; U4.49 v1(124.68,69) ; U1.49 v1(18.72,70.97) ; C69.2 v1(28,37.2) ; 4.4,50.7 4.9,50.7 ; U35.2 v1(99.07,55.08) ; U1.44 v1(17.75,73.63) U1.43 ; C7.2 v1(47.1,69) ; U13.10 v1(44.65,65.1) ; C12.2 v1(79.1,72.25) C11.2 ; R56.2 v1(129.7,49.5) ; C38.2 v1(64.48,39.02) ; U19.3 v1(9.5,26.95) ; R117.2 v1(137.2,15.75) ; U3.52 v1(82.32,64.7) ; U1.49 U1.49 ; C30.2 v1(19.1,42.25) ; C47.2 v1(138.65,30) ; C10.2 v1(80.95,68.2) ; U25.9 v1(19.35,36.07) ; U2.49 v1(56.67,69) ; U1.49 v1(22.67,69) ; U3.45 v1(84.95,73.63) U3.44 ; U3.49 v1(90.68,67.03) ; C53.2 v1(16.2,51.1) ; C34.2 v1(36.75,41.1) ; C29.2 v1(21.75,38.9) ; U14.1 v1(85.78,53.85) ; D10.2 v1(70.24,20) ; U13.4 v1(44,59.5) ; R63.2 v1(115.45,52.5) R64.2 ; U4.49 U4.49 ; U3.40 v1(88.95,73.63) ; v1(88.95,73.63) U3.43 ; v1(88.95,73.63) U3.42 ; v1(88.95,73.63) U3.39 ; U36.8 v1(101.97,45.93) ; U18.13 v1(111.32,52.13) U18.14 ; R66.2 v1(29,48.8) ; C43.2 v1(114.65,30) ; U30.6 v1(134.82,40.85) ; R89.2 v1(41.2,15.75) ; C68.2 v1(24.88,45.32) ; U13.1 v1(41.78,59.05) ; R78.2 v1(20.95,31.5) ; D8.2 v1(46.24,20) ; C36.2 v1(59.95,32.95) ; D15.2 v1(134.24,20) ; C24.2 v1(95.95,46.45) ; R103.2 v1(89.2,15.75) ; U27.9 v1(63.2,38) ; C6.2 v1(47.15,66.75) ; C27.2 v1(20.2,28.45) ; U2.49 U2.49 ; U3.49 v1(88.7,70.97) ; C26.2 v1(84.7,59.2) ; R85.2 v1(43.45,37.5) ; U15.7 v1(133.95,64.3) ; C41.2 v1(89.25,42.65) ; U11.5 v1(137.94,24.09) ; U34.2 v1(61.55,48.5) ; Q5.2 v1(107.27,44.6) ; R62.2 v1(112.5,54.7) ; C39.2 v1(90.65,30) ; Q4.2 v1(77.27,21.6) ; C42.2 v1(84.35,41.5) ; D5.2 v1(16.04,20) ; C32.2 v1(35.95,32.95) ; U1.51 v1(26.6,64.32) ; C3.2 v1(13.1,68.5) ; U26.9 v1(40.3,39) ; D2.2 v1(25.91,32.89) ; C28.2 v1(5.2,25.45) ; U3.38 v1(90.55,73.63) ; U3.49 v1(88.7,69) ; C59.2 v1(25.2,57.35) ; U36.2 v1(97.38,46.63) ; U16.1 v1(120.78,51.85) ; C35.2 v1(68.2,28.45) ; U10.5 v1(113.94,24.09)
  Top Layer w0.35: C64.2 v1(49.6,51.05) ; C63.2 v1(47.2,51.05) ; U32.9 v1(32.7,54.9) ; U32.9 v1(31.3,54.9) ; U32.9 v1(32.7,53.1) ; U32.9 v1(31.3,53.1) ; U33.9 v1(31.3,46.9) ; U33.9 v1(32.7,45.1) ; U33.9 v1(31.3,45.1) ; U33.9 v1(32.7,46.9) ; C58.2 v1(38.15,50.95) ; C67.2 v1(38.15,42.95) ; R131.2 v1(31.25,50.1) ; C71.2 v1(44.8,43.05) ; U33.1 v1(29,48.8) ; U32.1 v1(29,56.8) ; R133.2 v1(31.25,42.1) ; C65.2 v1(52,51.05) ; C72.2 v1(47.2,43.05) ; C73.2 v1(49.6,43.05) ; C62.2 v1(44.8,51.05) ; C74.2 v1(52,43.05)
  Top Layer w0.5: U5.41 U5.41 ; D1.2 v1(14.1,31.1) ; D1.2 v1(12.5,31.1) ; D1.2 v1(13.3,31.1) ; D1.2 v1(14.9,31.1) ; U5.41 U5.41 ; U5.41 U5.41
  Top Layer w0.6: J1.2 v1(6.5,31.3) ; J1.2 v1(5.3,33.7) ; J1.2 v1(5.3,31.3) ; J1.2 v1(7.7,31.3)
  Top Layer w0.8: U32.1 C61.2 ; U33.1 C70.2
  Inner2 w0.5: v1(3.7,54) 6.5,54
  vias: v1(6.7,54) v1(18.72,69) v1(18.72,67.03) v1(20.7,70.97) v1(26.7,33) v1(27.4,33) v1(28.1,33) v1(29.3,26.5) v1(29.9,26.1) v1(30.5,26.5) v1(31,37.4) v1(31,36.7) v1(31.1,26.1) v1(31.2,38.1) v1(52.72,69) v1(52.72,67.03) v1(54.7,70.97) v1(87,62.25) v1(99.7,62.25) v1(120.72,69) v1(120.72,67.03) v1(122.7,70.97) v1(137.95,64.5)
B32_BOOT: length 1.9
  Top Layer w0.25: U32.7 C57.1
B32_FB: length 4
  Top Layer w0.2: U32.5 R130.2 R131.1
B32_SW: length 5.9
  Top Layer w1: L1.1 38.69,55.91 U32.8
B32_VCC: length 1.9
  Top Layer w0.3: U32.6 C58.1
B33_BOOT: length 1.9
  Top Layer w0.25: U33.7 C66.1
B33_FB: length 4
  Top Layer w0.2: U33.5 R132.2 R133.1
B33_SW: length 5.9
  Top Layer w1: U33.8 38.69,47.91 L2.1
B33_VCC: length 1.9
  Top Layer w0.3: U33.6 C67.1
BASE_3V3_PG: length 147.6
  Top Layer w0.15: v1(31.3,40.8) 31.7,41.2 33,41.2 ; 63.4,50.7 62.5,49.8 62.5,45.2 61.5,44.2 59.5,44.2 58.3,43 53.9,43 53.8,42.9 53.7,42.9 53.5,42.7 53.5,42.6 53.4,42.5 53.4,42.4 52.2,41.2 52.2,41.1 52,40.9 52,40 v1(42.9,30.9) ; v1(34,28.9) 34,26 34.7,25.3 34.7,23.9 35.1,23.5 36.4,23.5 37.9,25 v1(37.9,26.1)
  Top Layer w0.152: 85.58,50.01 64.16,50.01 63.56,50.61 ; 34.91,49.56 35.4,49.56 35.48,49.48 ; 33.48,44.34 32.35,43.21 ; 33.51,49.22 33.51,45.04 33.56,44.98
  Top Layer w0.203: 33.56,44.98 33.56,44.42 33.48,44.34 ; 33.51,49.22 34.58,49.22 34.91,49.56 ; 35.48,49.48 51.23,49.48 52.56,50.81 ; 63.56,50.61 63.36,50.81 ; U33.4 31.46,44.09 33.09,42.47 33.09,40.5 R74.2 ; 85.58,50.01 89.06,46.53 91.96,46.53 97.99,40.5 R75.1 102.91,40.5 102.91,40.87 104.09,42.05 Q5.1
  Bottom Layer w0.15: v1(37.9,26.1) 42.3,30.5 42.4,30.5 42.5,30.6 42.6,30.6 v1(42.9,30.9) ; v1(31.3,40.8) 31.3,40.7 31,40.4 31,38.7 30.6,38.3 30.6,37.8 30.4,37.6 30.4,32.5 30.6,32.3 30.6,31.8 31,31.4 31.5,31.4 v1(34,28.9)
BL_A: length 27.2
  Top Layer w0.203: U10.6 111.66,25.36 106.59,20.3 106.59,20 ; 106.59,20 106.59,16.49 107.33,15.75 R108.1 108,14.92 106.5,13.42 R109.2 106.5,12.09 110.41,12.09 J9.3 ; 106.59,20 D13.1
BL_B: length 21.3
  Top Layer w0.152: 110.66,13.12 110.66,13.49
  Top Layer w0.203: U10.7 114.51,25.36 114.51,21.12 113.4,20 D14.1 112.11,18.54 111,17.43 R110.1 110.17,15.75 ; R108.2 110.17,15.75 ; 110.17,15.75 110.17,13.97 110.66,13.49 ; 110.66,13.12 v1(110.62,13.12)
  Bottom Layer w0.203: v1(110.62,13.12) 110.62,12.12 J9.4
BL_DE_CMD: length 53
  Top Layer w0.203: v1(134.25,56.3) 139.01,56.3 142.6,59.89 U5.6 142.6,61.91 139.92,61.91 139.5,62.33 R58.1 ; U23.1 v1(112.82,32.05)
  Bottom Layer w0.203: v1(134.25,56.3) 134.25,52.09 133.32,51.16 133.32,50.36 129.23,46.27 129.23,43.23 118.05,32.05 v1(112.82,32.05)
BL_DE_HW: length 10.6
  Top Layer w0.203: v1(108.73,27.21) 108.16,26.64 U10.2 U10.3 ; v1(109.52,33.03) 110.01,33.53 110.01,33.95 U23.4
  Bottom Layer w0.203: v1(108.73,27.21) 108.73,32.25 v1(109.52,33.03)
BL_ILIM: length 2.1
  Top Layer w0.203: R106.1 112.33,36 U29.4
BL_POWER_EN: length 30.5
  Top Layer w0.203: v1(107.31,36.54) 109.21,36.54 U29.1 U29.2 ; v1(127.83,45.58) 128.34,46.1 128.34,46.5 R105.2
  Bottom Layer w0.152: 111.47,38.36 111.22,38.36 110.06,37.21 ; 128.03,44.49 127.84,44.67 127.84,45
  Bottom Layer w0.203: 111.47,38.36 115.93,42.82 127.28,42.82 128.03,43.57 128.03,44.49 ; v1(107.31,36.54) 107.98,37.21 110.06,37.21 ; v1(127.83,45.58) 127.83,45.02 127.84,45
BL_RETRY: length 2.1
  Top Layer w0.203: U29.5 112.33,42 R107.2
BL_RO: length 2.4
  Top Layer w0.203: U10.1 106.85,27 R104.1
BL_RX: length 57.9
  Top Layer w0.152: 138.84,55.61 139.48,55.61 v1(139.69,55.82)
  Top Layer w0.203: v1(109.33,29.08) 107.03,29.08 106.44,28.5 R104.2 ; v1(133.67,55.55) 138.78,55.55 138.84,55.61 ; U5.4 145.14,59.89 145.1,59.89 v1(144.87,59.66)
  Bottom Layer w0.203: v1(144.87,59.66) 141.04,55.82 v1(139.69,55.82) ; v1(133.67,55.55) 133.67,52.03 132.96,51.31 132.96,50.51 128.87,46.42 128.87,43.39 127.58,42.09 122.05,42.09 109.33,29.38 v1(109.33,29.08)
BL_TX: length 57.6
  Top Layer w0.203: v1(134.28,51.09) 134.58,50.79 v1(139.01,50.79) ; U10.4 110.94,27.27 114.26,27.27 ; U5.5 v1(143.87,59.66)
  Bottom Layer w0.203: v1(134.28,51.09) 134.28,50.8 129.59,46.12 129.59,43.08 114.28,27.77 v1(114.28,27.27) ; v1(139.01,50.79) 139.01,55.94 142.73,59.66 v1(143.87,59.66)
BL_VPROBE: length 34.1
  Top Layer w0.25: 110.2,41.8 110.2,42.4 109.8,42.8 109.2,42.8 107.6,41.2 107.4,41.2 107.2,41 107.2,39.8 v1(107,39.6)
  Inner2 w0.8: 111.2,14.2 111.2,14.4 111,14.6 111,14.8 110.8,15 110.8,15.2 110.6,15.4 110.6,15.6 110.4,15.8 110.4,16 110.2,16.2 110.2,16.6 110,16.8 110,17 109.8,17.2 109.8,17.4 109.6,17.6 109.6,17.8 109.4,18 109.4,18.2 109.2,18.4 109.2,18.8 109,19 109,19.2 108.8,19.4 108.8,19.6 108.6,19.8 108.6,20 108.4,20.2 108.4,20.4 108.2,20.6 108.2,21 108,21.2 108,21.4 107.8,21.6 107.8,21.8 107.6,22 107.6,22.2 107.4,22.4 107.4,22.6 107.2,22.8 107.2,23.2 107,23.4 107,23.6 106.8,23.8 106.8,24 106.6,24.2 106.6,24.4 106.4,24.6 106.4,24.8 106.2,25 106.2,25.4 106,25.6 106,25.8 105.8,26 v1(105.8,32.8)
  Bottom Layer w0.4: v1(105.8,32.8) 105.8,37.2 107,38.4 v1(107,39.6)
BR_A: length 27.2
  Top Layer w0.203: U11.6 135.65,25.36 130.37,20.09 130.37,20 ; D15.1 130.37,20 ; 130.37,20 130.37,16.71 131.33,15.75 R115.1 132,14.92 130.5,13.42 R116.2 130.5,12.09 134.41,12.09 J10.3
BR_B: length 20.9
  Top Layer w0.203: 134.17,15.75 134.28,15.63 v1(134.28,14.94) ; 134.17,15.75 R117.1 135,17.43 136.11,18.54 D16.1 137.4,20 138.5,21.11 138.5,25.37 U11.7 ; 134.17,15.75 R115.2
  Bottom Layer w0.203: J10.4 134.28,11.78 v1(134.28,14.94)
BR_DE_CMD: length 33.2
  Top Layer w0.203: U24.1 v1(134.78,32.05) ; R59.1 137.25,62.33 137.52,62.06 U5.10 137.52,59.89 137.3,59.66 v1(137.3,59.3)
  Bottom Layer w0.203: v1(137.3,59.3) 135.78,57.77 135.78,33.04 v1(134.78,32.05)
BR_DE_HW: length 11.3
  Top Layer w0.203: v1(132.91,26.24) 132.15,26.24 ; 132.15,26.24 U11.2 ; 132.15,26.24 132.15,25.76 U11.3 ; v1(133.5,33.02) 134.01,33.53 134.01,33.95 U24.4
  Bottom Layer w0.203: v1(132.91,26.24) 133.5,26.84 v1(133.5,33.02)
BR_ILIM: length 1.8
  Top Layer w0.203: U30.4 136.41,35.85 136.56,36 R113.1
BR_POWER_EN: length 21.1
  Top Layer w0.152: 127.5,49.01 127.07,49.01 126.87,49.2 ; 127.94,42.98 127.94,43.49 128.3,43.86
  Top Layer w0.203: 126.87,49.2 126.63,49.45 125.47,49.45 125.33,49.3 125.33,47.13 128.3,44.15 128.3,43.86 ; U30.2 U30.1 132.39,35.85 127.92,40.33 127.92,42.95 127.94,42.98 ; R112.2 127.5,48.76 127.5,49.01
BR_RETRY: length 4.1
  Top Layer w0.203: R114.2 138.75,40.59 138.66,40.5 135.83,40.5 U30.5
BR_RO: length 2.4
  Top Layer w0.203: U11.1 130.85,27 R111.1
BR_RX: length 39.2
  Top Layer w0.203: R111.2 v1(130.65,28.5) ; v1(140.04,59.68) 140.06,59.71 U5.8
  Bottom Layer w0.203: v1(140.04,59.68) 139.84,59.88 137.09,59.88 135.42,58.21 135.42,50.91 130.65,46.15 v1(130.65,28.5)
BR_TX: length 40.4
  Top Layer w0.203: U5.9 v1(138.79,59.31) ; U11.4 v1(133,24.09)
  Bottom Layer w0.203: v1(138.79,59.31) 138.43,58.95 138.43,40.95 136.39,38.92 136.39,27.49 v1(133,24.09)
BR_VPROBE: length 35.6
  Top Layer w0.25: 134.2,40.8 134.2,41.6 133.8,42 133.2,42 132.8,41.6 132.8,41.2 133,41 133,40.4 132.8,40.2 132.6,40.2 131.8,39.4
  Top Layer w0.4: v1(129.2,40) 129.8,39.4 130.6,39.4
  Inner2 w0.8: v1(133,25.2) 133.2,25 133.4,25 134,24.4 134,21.6 135.2,20.4 135.2,14.2
  Bottom Layer w0.6: v1(129.2,40) 129.2,28.8 132.8,25.2 v1(133,25.2)
BRAKE_ARM: length 53.8
  Top Layer w0.152: 134.01,30.87 134.01,32.08 134.07,32.14 ; v1(134.77,32.96) 135.11,33.3 135.5,33.3
  Top Layer w0.203: v1(133.08,47.78) 133.08,47.8 132.06,48.83 U5.23 129.16,48.83 129,48.66 R56.1 128.31,48 127.76,47.45 126.83,47.45 ; R112.1 126.66,48.75 126.66,47.62 126.83,47.45 ; 134.01,30.87 130.46,30.87 128.33,33 U23.2 ; 126.83,47.45 126.83,46.5 R105.1 ; U24.2 135.5,33.3 ; v1(134.77,32.96) 134.07,32.26 134.07,32.14
  Bottom Layer w0.152: 132.83,41.34 132.83,41.07 132.96,40.93
  Bottom Layer w0.203: v1(133.08,47.78) 132.83,47.52 132.83,41.34 ; v1(134.77,32.96) 132.96,34.76 132.96,40.93
BRAKE_BOOT: length 23.4
  Top Layer w0.203: v1(128.73,40.91) 128.3,41.34 128.3,42.51 128.63,42.84 129,42.84 R55.2 129.69,43.5 130.3,44.11 132.44,44.11 U5.27
  Bottom Layer w0.203: v1(128.73,40.91) 127.5,39.67 J15.6
BRAKE_CS: length 5.8
  Top Layer w0.203: R51.2 126.75,57.09 127.42,57.09 129.33,55.17 U5.18
BRAKE_CS_B: length 3.1
  Top Layer w0.203: R51.1 126.06,56.25 125.5,55.69 124.95,55.69 U16.8
BRAKE_EN: length 62.2
  Top Layer w0.203: R54.2 141.69,64.5 ; 141.69,64.5 146.38,64.5 146.39,64.5 C18.1 147.71,64.5 147.71,62.44 147.19,61.91 146.41,61.91 U5.3 ; 141.69,64.5 141.79,64.4 v1(141.91,64.4)
  Bottom Layer w0.203: J15.4 123.5,36.48 129.96,42.93 129.96,45.97 134.84,50.85 134.84,60.6 139.7,65.46 139.7,66.07 140.2,66.56 140.69,66.56 141.91,65.34 v1(141.91,64.4)
BRAKE_MISO: length 15.5
  Top Layer w0.203: v1(121.99,58.13) 122.21,57.91 122.35,57.91 U16.12 ; v1(125,54.37) v1(122.71,54.37) ; v1(128.19,51.69) 129.71,51.69 130.03,51.36 U5.21
  Bottom Layer w0.203: v1(128.19,51.69) 127.12,51.69 125,53.8 v1(125,54.37) ; v1(122.71,54.37) 121.99,55.09 v1(121.99,58.13)
BRAKE_MISO_B: length 3.2
  Top Layer w0.203: U16.11 123,57.91 122.91,58 122.91,59.25 R52.1
BRAKE_MOSI: length 8
  Top Layer w0.203: v1(126.98,52.64) 126.75,52.42 R50.2 ; U5.19 v1(132.27,53.91)
  Bottom Layer w0.203: v1(126.98,52.64) 128.24,53.91 v1(132.27,53.91)
BRAKE_MOSI_B: length 6.5
  Top Layer w0.203: v1(127.66,50.41) 127.61,50.41 127.44,50.25 R50.1 ; v1(124.52,52.56) 124.3,52.34 U16.6
  Bottom Layer w0.203: v1(124.52,52.56) 125.5,52.56 v1(127.66,50.41)
BRAKE_SCK: length 11.2
  Top Layer w0.152: 130.08,53.02 129.98,53.02 129.9,53.1
  Top Layer w0.203: R49.2 v1(123.87,48.75) ; 129.9,53.1 v1(129.71,53.29) ; 130.08,53.02 130.66,53.02 U5.20
  Bottom Layer w0.203: v1(123.87,48.75) 126.8,48.75 128.96,50.91 128.96,52.57 129.67,53.29 v1(129.71,53.29)
BRAKE_SCK_B: length 3.2
  Top Layer w0.203: U16.3 122.35,50.09 122.16,49.9 122.16,48.75 R49.1
BUZZER_CMD: length 8.9
  Top Layer w0.203: v1(141.33,59.66) U5.7 ; R60.1 140.44,66
  Bottom Layer w0.203: v1(141.33,59.66) 140.44,60.56 v1(140.44,66)
BUZZER_GATE: length 94
  Top Layer w0.203: v1(77.76,19.79) 77.76,19.05 Q4.1 76.24,19.05 76.84,18.45 76.84,18.29 76.5,17.94 R61.1 ; R60.2 139.5,66.84 138.83,66.84 v1(138.75,66.75)
  Bottom Layer w0.203: v1(138.75,66.75) 133.1,61.1 133.1,55.11 133.2,55 133.2,52.07 132.59,51.46 132.59,50.66 128.49,46.55 128.49,43.52 127.43,42.46 116.34,42.46 94.51,20.63 78.61,20.63 v1(77.76,19.79)
BUZZER_LOW: length 18.2
  Top Layer w0.203: BZ1.2 74.24,14.06 74.24,20 ; Q4.3 74.24,20 ; 74.24,20 74.24,20.44 76.77,22.97 77.5,22.97 D4.1
CS_BRAKE: length 29.1
  Top Layer w0.203: 121.7,55.69 120.87,54.86 115.2,54.86 114.56,55.5 104.06,55.5 103.62,55.06 U35.9 ; 121.7,55.69 124.3,55.69 U16.9 124.3,57.91 125.12,57.91 126.09,58.88 126.09,59.25 R53.2 ; 121.7,55.69 U16.13
CS_FL: length 163.1
  Top Layer w0.15: U12.9 v1(21.3,59.95) ; 23.3,60 23.4,60 24,60.6 ; 24.6,60.3 24.6,60.6 ; 32.4,63 v1(35.1,60.3)
  Top Layer w0.203: U12.13 v1(18.7,57.45) ; 24,60.67 24.67,60.67 26.61,62.62 31.93,62.62 33.58,64.27 ; v1(105.29,56.61) 103.37,56.61 102.87,57.12 102.01,57.12 101.03,56.14 U35.5 ; v1(23.1,59.78) 23.31,59.98 23.31,60 ; v1(95.71,71.33) 96.11,71.73 v1(99.22,71.73) ; v1(69.66,71.05) 66.47,71.05 v1(65.47,72.05)
  Bottom Layer w0.15: 21.1,59.8 18.9,57.6 ; 106.2,58.7 106.8,58.7 108.7,60.6 108.7,60.7 111,63 111,66.8 111.3,67.1 111.3,68.9 111.2,69 102.2,69 99.5,71.7 ; v1(35.1,60.3) 35.1,62.7 33.6,64.2
  Bottom Layer w0.203: v1(23.1,59.78) 23.1,54.8 25.32,52.57 25.32,48.53 24.98,48.19 24.5,48.19 18.7,53.99 v1(18.7,57.45) ; v1(65.47,72.05) 65.24,72.28 41.6,72.28 33.58,64.27 ; v1(69.66,71.05) 85.85,71.05 86.34,71.55 95.5,71.55 v1(95.71,71.33) ; v1(105.29,56.61) 106.13,57.45 106.13,58.92 105.71,59.34 105.71,65.24
CS_FR: length 152.5
  Top Layer w0.15: v1(111.7,60.3) 111.7,62.9 v1(113.1,64.3) ; 102.5,56.4 103.1,56.4 103.3,56.2 104.9,56.2 105,56.1 105.1,56.1 105.2,56 105.4,56 105.5,56.1 v1(107.5,56.1)
  Top Layer w0.203: v1(40.59,65.32) 40.8,65.11 42.7,65.11 U13.13 ; v1(102.26,56.55) 101.68,55.97 U35.6 ; R17.2 49.5,62.92 48.11,62.92 46.98,64.05 46.98,64.41 46.28,65.11 45.3,65.11 U13.9
  Bottom Layer w0.15: 98.5,71.7 98.7,71.9 98.7,72 99,72.3 99.4,72.3 99.5,72.2 99.6,72.2 102.4,69.4 111.2,69.4 111.3,69.3 111.4,69.3 111.6,69.1 111.6,69 111.7,68.9 111.7,65.9 112.8,64.8 112.8,64.6 v1(113.1,64.3) ; v1(107.5,56.1) v1(111.7,60.3)
  Bottom Layer w0.203: v1(40.59,65.32) 45.89,70.61 48.53,70.61 49.84,71.92 61.8,71.92 62.6,71.12 62.6,70.49 62.38,70.27 62.38,69.19 ; v1(102.26,56.55) 104.43,56.55 105.77,57.89 105.77,58.67 105.34,59.1 105.34,64.83 ; 62.38,69.19 61.44,68.25 49.04,68.25 48.43,67.64 48.43,67.15 48.8,66.77 49.61,66.77 50.56,65.82 51.91,65.82 52.52,65.21 52.52,64.74 51.9,64.12 47.14,64.12 v1(46.98,64.28) ; 62.38,69.19 63.41,69.19 67.03,72.81 97.34,72.81 98.98,71.17 99,71.17
CS_PLUS: length 3.1
  Top Layer w0.2: 13.1,56.7 13.2,56.6 13.2,56.5 13.3,56.4 13.3,56.3 13.5,56.1 13.5,55 12.8,54.3 12.8,54.1
CS_RL: length 27.4
  Top Layer w0.128: 86.52,61.57 86.38,61.7 86.29,61.7
  Top Layer w0.152: 89.4,57.72 89.21,57.91 89.21,58.04 ; 86.52,61.51 86.52,61.57
  Top Layer w0.203: 89.4,57.72 89.4,57.7 90.03,57.07 93.15,57.07 93.55,57.47 v1(99.34,57.47) ; U35.7 102.32,55.66 v1(102.25,55.74) ; 89.21,58.04 89.3,58.13 U14.9 89.3,61.51 ; R29.2 89.34,62.25 89.3,62.21 89.3,61.51 ; 86.29,61.7 86.29,60.18 86.56,59.91 86.7,59.91 U14.13 ; 89.3,61.51 86.52,61.51
  Bottom Layer w0.203: v1(99.34,57.47) 100.51,57.47 v1(102.25,55.74)
CS_RR: length 45.6
  Top Layer w0.203: R41.2 136.59,66.75 136.59,67.12 136.2,67.51 133.48,67.51 133.3,67.69 ; U35.8 102.97,55.06 102.94,55.1 v1(102.94,55.3) ; v1(129.37,69.67) 129.61,69.91 130.7,69.91 U15.13 130.7,67.69 133.3,67.69 ; 133.3,67.69 U15.9
  Bottom Layer w0.152: 120.54,69.61 120.4,69.47 120.34,69.47
  Bottom Layer w0.203: 120.54,69.61 129.3,69.61 v1(129.37,69.67) ; v1(102.94,55.3) 103.56,55.92 105.92,55.92 119.48,69.47 120.34,69.47
